# Altium project Monitor_Node.PrjPcb
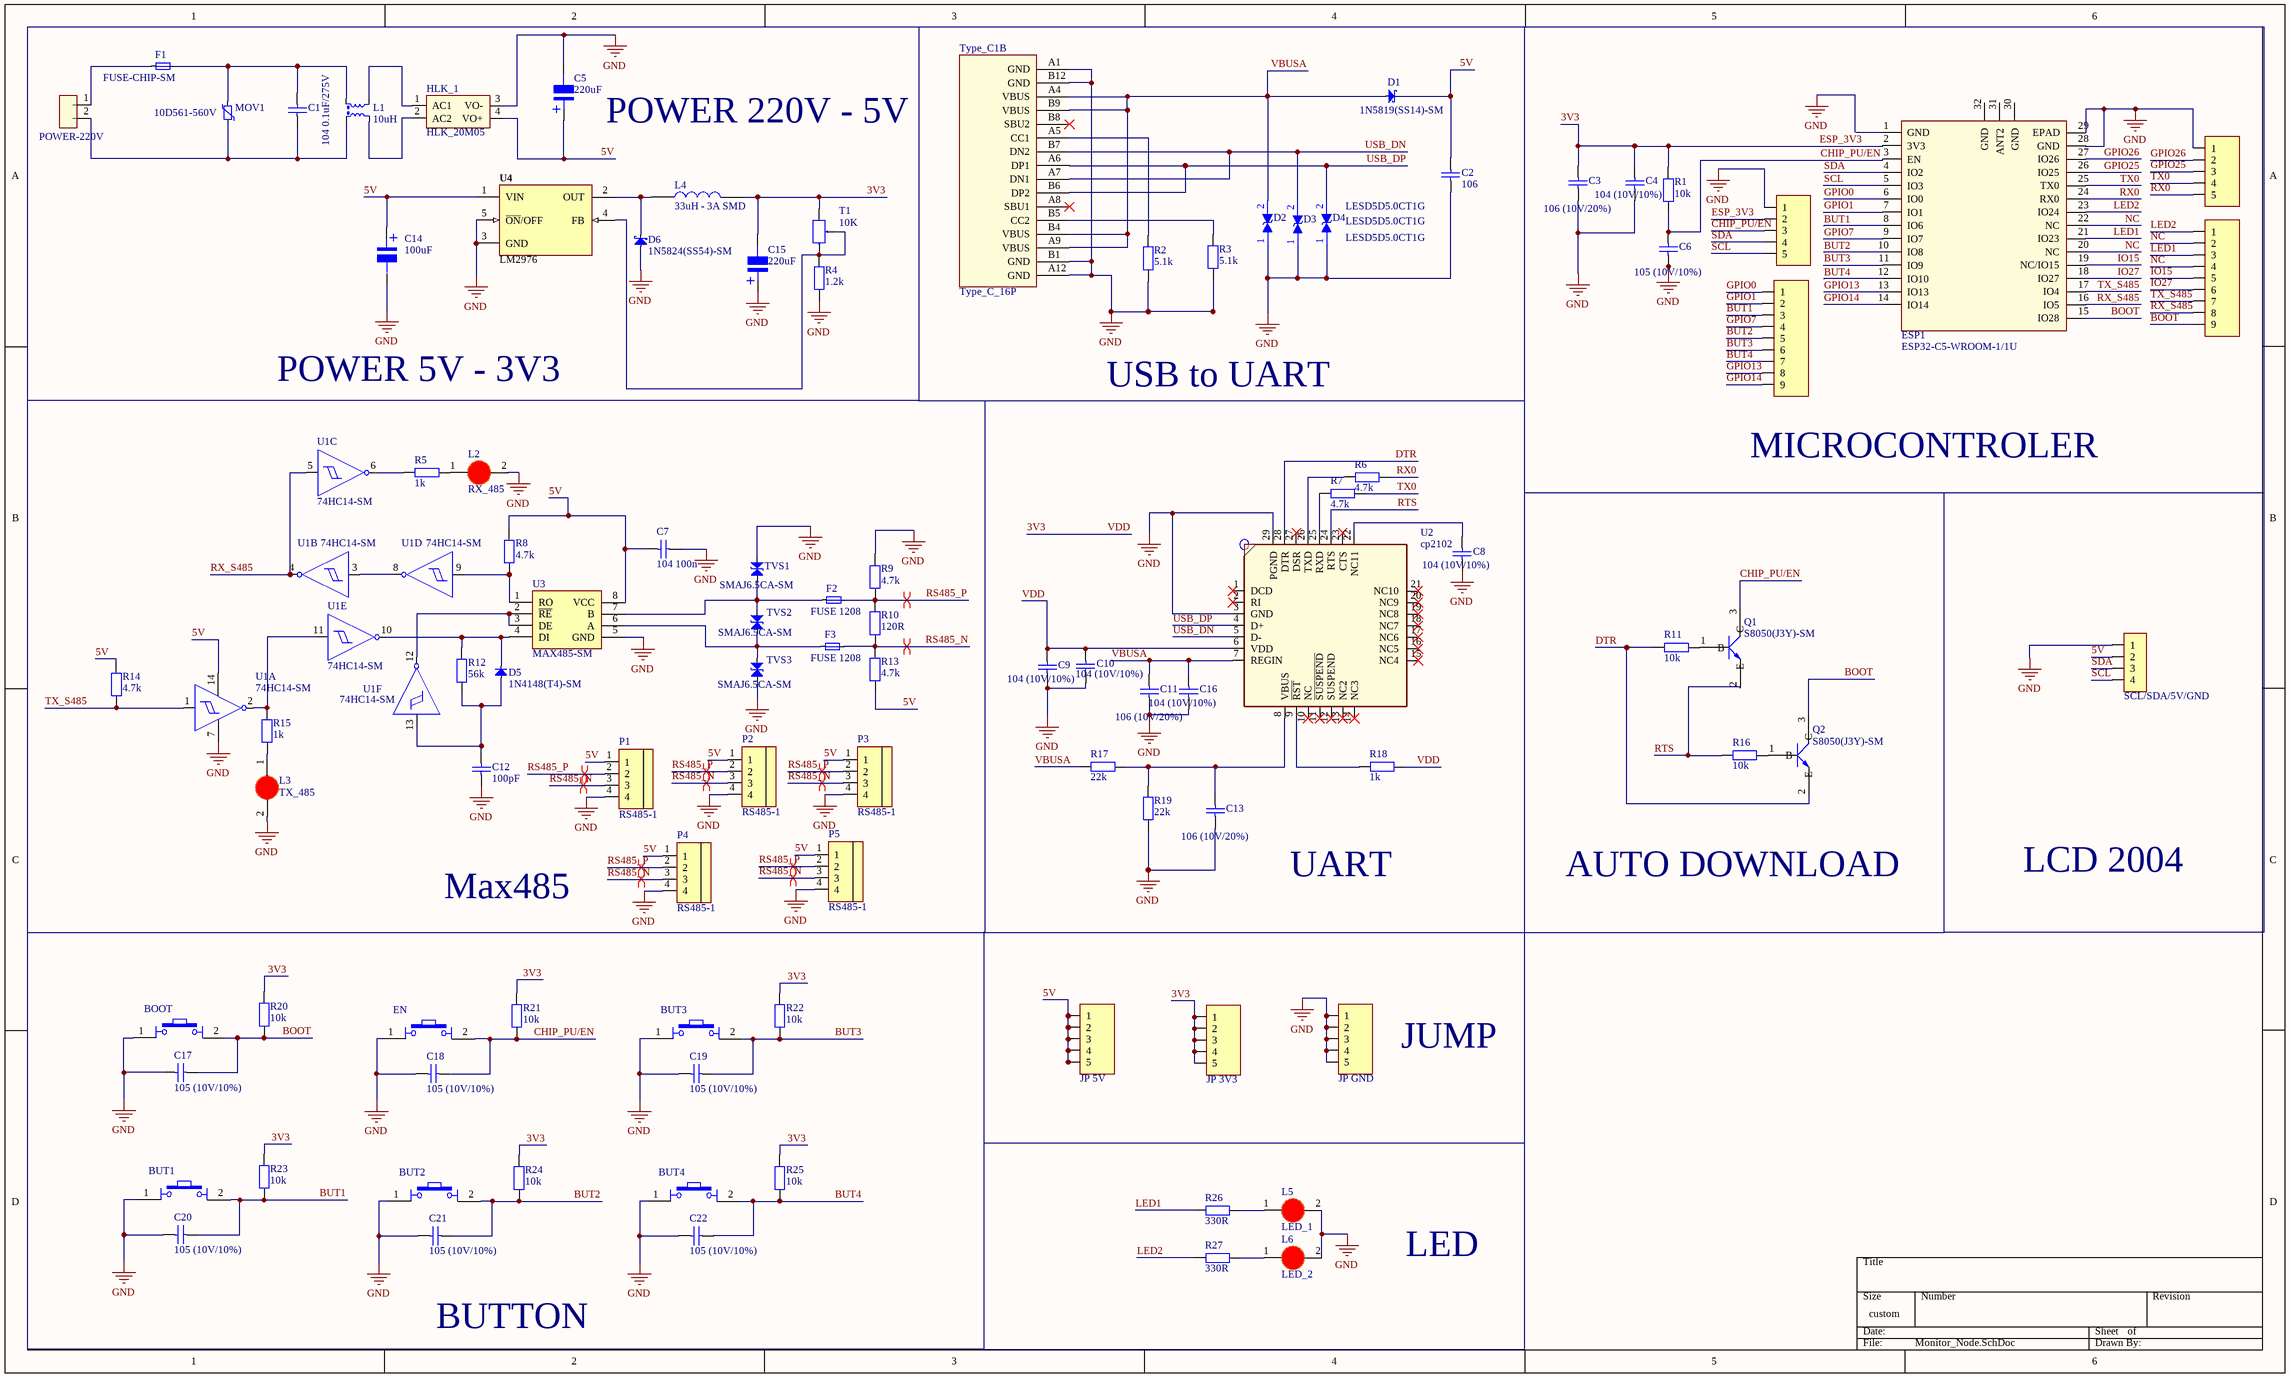
[diagram p0: Monitor_Node.SchDoc]
1 sheet, 98 parts. Net scope: global (net labels, ports and power ports of the same name join across sheets).
Board file: Monitor_Node.PcbDoc

## Sheet Monitor_Node.SchDoc
size 500 x 299 mm; SheetNumber: 1; SheetTotal: 1

### Parts
BT1  BOOT  [Nut Nhan 4 Chan Cam 6x6]
BT2  EN  [Nut Nhan 4 Chan Cam 6x6]
BT3  BUT3  [Nut Nhan 4 Chan Cam 6x6]
BT4  BUT1  [Nut Nhan 4 Chan Cam 6x6]
BT5  BUT2  [Nut Nhan 4 Chan Cam 6x6]
BT6  BUT4  [Nut Nhan 4 Chan Cam 6x6]
C1  104 0.1uF/275V  [tu 0805]
C2  106  [tu 0805]
C3  106 (10V/20%)  [tu 0805]
C4  104 (10V/10%)  [tu 0805]
C5  220uF  [tu nhom 8 (e)]
C6  105 (10V/10%)  [tu 0805]
C7  104 100n  [tu 0805]
C8  104 (10V/10%)  [tu 0805]
C9  104 (10V/10%)  [tu 0805]
C10  104 (10V/10%)  [tu 0805]
C11  106 (10V/20%)  [tu 0805]
C12  100pF  [tu 1206]
C13  106 (10V/20%)  [tu 0805]
C14  100uF  [tu nhom 8 (f)]
C15  220uF  [tu nhom 8 (e)]
C16  104 (10V/10%)  [tu 0805]
C17  105 (10V/10%)  [tu 0805]
C18  105 (10V/10%)  [tu 0805]
C19  105 (10V/10%)  [tu 0805]
C20  105 (10V/10%)  [tu 0805]
C21  105 (10V/10%)  [tu 0805]
C22  105 (10V/10%)  [tu 0805]
D1  1N5819(SS14)-SM  [SMA-J_DO-214AC]
D2  LESD5D5.0CT1G  [LESD5D5.0CT1G,]
D3  LESD5D5.0CT1G  [LESD5D5.0CT1G,]
D4  LESD5D5.0CT1G  [LESD5D5.0CT1G,]
D5  1N4148(T4)-SM  [SOD123G_DO-215AD]
D6  1N5824(SS54)-SM  [SMA-J_DO-214AC]
ESP1  ESP32-C5-WROOM-1/1U  [ESP32-C5-WROOM-1/1U]
F1  FUSE-CHIP-SM  [FUSE-CHIP-1812-SM]
F2  FUSE 1208  [FUSE-CHIP-1812-SM]
F3  FUSE 1208  [FUSE-CHIP-1812-SM]
HB1  POWER-220V  [HB9500]
HLK_1  HLK_20M05  [HLK_20M05]
JP1  JP esp  [JP 1x5 DT]  (value not drawn)
JP2  JP esp  [JP 1x5 DT]  (value not drawn)
JP3  JP esp  [JP 1x9 DT]  (value not drawn)
JP4  JP esp  [JP 1x9 DT]  (value not drawn)
JP5  SCL/SDA/5V/GND  [JP 1x4 DT]
JP6  JP 5V  [JP 1x5 DT]
JP7  JP 3V3  [JP 1x5 DT]
JP8  JP GND  [JP 1x5 DT]
L1  10uH  [L-UU9.8-L17.0-W12.0-H17.0-TH]
L2  RX_485  [LED-3MM-RED]
L3  TX_485  [LED-3MM-RED]
L4  33uH - 3A SMD  [Cuon Cam 12x12x10]
L5  LED_1  [LED-3MM-RED]
L6  LED_2  [LED-3MM-RED]
MOV1  10D561-560V  [MOV-P7.5-D17.0-T3.6-TH]
P1  RS485-1  [15EDG - 4P]
P2  RS485-1  [15EDG - 4P]
P3  RS485-1  [15EDG - 4P]
P4  RS485-1  [15EDG - 4P]
P5  RS485-1  [15EDG - 4P]
Q1  S8050(J3Y)-SM  [SOT23-3_TO-236AB]
Q2  S8050(J3Y)-SM  [SOT23-3_TO-236AB]
R1  10k  [tro smd 0805]
R2  5.1k  [tro smd 0805]
R3  5.1k  [tro smd 0805]
R4  1.2k  [tro smd 0805]
R5  1k  [tro smd 0805]
R6  4.7k  [tro smd 0805]
R7  4.7k  [tro smd 0805]
R8  4.7k  [tro smd 0805]
R9  4.7k  [tro smd 0805]
R10  120R  [tro smd 0805]
R11  10k  [tro smd 0805]
R12  56k  [TRO SMD 0805]
R13  4.7k  [tro smd 0805]
R14  4.7k  [tro smd 0805]
R15  1k  [tro smd 0805]
R16  10k  [tro smd 0805]
R17  22k  [tro smd 0805]
R18  1k  [tro smd 0805]
R19  22k  [tro smd 0805]
R20  10k  [tro smd 0805]
R21  10k  [tro smd 0805]
R22  10k  [tro smd 0805]
R23  10k  [tro smd 0805]
R24  10k  [tro smd 0805]
R25  10k  [tro smd 0805]
R26  330R  [Tro SMD 0805]
R27  330R  [Tro SMD 0805]
T1  10K  [Bien Tro Vi Chinh Dung]
TVS1  SMAJ6.5CA-SM  [SMA-J_DO-214AC_TVS-BI]
TVS2  SMAJ6.5CA-SM  [SMA-J_DO-214AC_TVS-BI]
TVS3  SMAJ6.5CA-SM  [SMA-J_DO-214AC_TVS-BI]
Type_C1  Type_C_16P  [Type_C_16P]  (part B of 2)
U1  74HC14-SM  [SOIC14-1.27-150MIL]  (parts A,B,C,D,E,F of 6)
U2  cp2102  [cp2102]
U3  MAX485-SM  [SOIC8-1.27-150MIL]
U4  LM2976  [TO263]

### Nets
GND: BT1.1 BT2.1 BT3.1 BT4.1 BT5.1 BT6.1 C2.2 C3.2 C4.2 C5.2 C6.2 C7.1 C8.2 C9.2 C10.2 C11.2 C12.2 C13.2 C14.2 C15.1 C16.2 C17.1 C18.1 C19.1 C20.1 C21.1 C22.1 D2.1 D3.1 D4.1 D6.1 ESP1.1(GND) ESP1.28(GND) ESP1.29(EPAD) HLK_1.3(VO-) JP1.1 JP2.1 JP5.1 JP8.1 JP8.2 JP8.3 JP8.4 JP8.5 L2.2(K) L3.2(K) L5.2(K) L6.2(K) P1.4 P2.4 P3.4 P4.4 P5.4 R2.1 R3.1 R4.1 R9.2 R19.1 TVS1.2 TVS3.1 Type_C1.A1(GND) Type_C1.A12(GND) Type_C1.B1(GND) Type_C1.B12(GND) U1.7(GND) U2.3(GND) U2.29(PGND) U3.5(GND) U4.3(GND) U4.5(~{ON}/OFF)
3V3: C3.1 C4.1 C9.1 C10.1 C15.2 ESP1.2(3V3) JP2.2 JP7.1 JP7.2 JP7.3 JP7.4 JP7.5 L4.2 R1.2 R18.2 R20.2 R21.2 R22.2 R23.2 R24.2 R25.2 T1.1 U2.6(VDD)  [also labelled ESP_3V3, VDD]
5V: C2.1 C5.1 C7.2 C14.1 D1.2 HLK_1.4(VO+) JP5.2 JP6.1 JP6.2 JP6.3 JP6.4 JP6.5 P1.1 P2.1 P3.1 P4.1 P5.1 R8.2 R13.1 R14.2 U1.14(VCC) U3.8(VCC) U4.1(VIN)
BOOT: BT1.2 C17.2 ESP1.15(IO28) JP3.9 Q2.3(C) R20.1
BUT1: BT4.2 C20.2 ESP1.8(IO6) JP4.3 R23.1
BUT2: BT5.2 C21.2 ESP1.10(IO8) JP4.5 R24.1
BUT3: BT3.2 C19.2 ESP1.11(IO9) JP4.6 R22.1
BUT4: BT6.2 C22.2 ESP1.12(IO10) JP4.7 R25.1
CHIP_PU/EN: BT2.2 C6.1 C18.2 ESP1.3(EN) JP2.3 Q1.3(C) R1.1 R21.1
DTR: Q2.2(E) R11.1 U2.28(DTR)
GPIO0: ESP1.6(IO0) JP4.1
GPIO1: ESP1.7(IO1) JP4.2
GPIO7: ESP1.9(IO7) JP4.4
GPIO13: ESP1.13(IO13) JP4.8
GPIO14: ESP1.14(IO14) JP4.9
GPIO25: ESP1.26(IO25) JP1.3
GPIO26: ESP1.27(IO26) JP1.2
IO15: ESP1.19(NC/IO15) JP3.5
IO27: ESP1.18(IO27) JP3.6
LED1: ESP1.21(IO23) JP3.3 R26.1
LED2: ESP1.23(IO24) JP3.1 R27.1
NC: ESP1.20(NC) ESP1.22(NC) JP3.2 JP3.4
RS485_N: F3.2 P1.3 P2.3 P3.3 P4.3 P5.3 R10.1 R13.2
RS485_P: F2.2 P1.2 P2.2 P3.2 P4.2 P5.2 R9.1 R10.2
RTS: Q1.2(E) R16.1 U2.24(RTS)
RX0: ESP1.24(RX0) JP1.5 R6.2
RX_S485: ESP1.16(IO5) JP3.8 U1.4(OUT) U1.5(IN)
SCL: ESP1.5(IO3) JP2.5 JP5.4
SDA: ESP1.4(IO2) JP2.4 JP5.3
TX0: ESP1.25(TX0) JP1.4 R7.2
TX_S485: ESP1.17(IO4) JP3.7 R14.1 U1.1(IN)
USB_DN: D3.2 Type_C1.A7(DN1) Type_C1.B7(DN2) U2.5(D-)
USB_DP: D4.2 Type_C1.A6(DP1) Type_C1.B6(DP2) U2.4(D+)
VBUSA: C11.1 C16.1 D1.1 D2.2 R17.1 Type_C1.A4(VBUS) Type_C1.A9(VBUS) Type_C1.B4(VBUS) Type_C1.B9(VBUS) U2.7(REGIN)
NetC1_1: C1.1 F1.2 L1.3 MOV1.1
NetC1_2: C1.2 HB1.2 L1.1 MOV1.2
NetC8_1: C8.1 U2.22(NC11)
NetC12_1: C12.1 D5.1 R12.1 U1.13(IN)
NetC13_1: C13.1 R17.2 R19.2 U2.8(VBUS)
NetD5_2: D5.2 R12.2 U1.10(OUT) U3.4(DI)
NetD6_2: D6.2 L4.1 U4.2(OUT)
NetF1_1: F1.1 HB1.1
NetF2_1: F2.1 TVS1.1 TVS2.2 U3.7(B)
NetF3_1: F3.1 TVS2.1 TVS3.2 U3.6(A)
NetHLK_1_1: HLK_1.1(AC1) L1.4
NetHLK_1_2: HLK_1.2(AC2) L1.2
NetL2_1: L2.1(A) R5.2
NetL3_1: L3.1(A) R15.1
NetL5_1: L5.1(A) R26.2
NetL6_1: L6.1(A) R27.2
NetQ1_1: Q1.1(B) R11.2
NetQ2_1: Q2.1(B) R16.2
NetR2_2: R2.2 Type_C1.A5(CC1)
NetR3_2: R3.2 Type_C1.B5(CC2)
NetR4_2: R4.2 T1.2 T1.3 U4.4(FB)
NetR5_1: R5.1 U1.6(OUT)
NetR6_1: R6.1 U2.26(TXD)
NetR7_1: R7.1 U2.25(RXD)
NetR8_1: R8.1 U1.9(IN) U3.1(RO)
NetR15_2: R15.2 U1.2(OUT) U1.11(IN)
NetR18_1: R18.1 U2.9(~{RST})
NetU1_3: U1.3(IN) U1.8(OUT)
NetU1_12: U1.12(OUT) U3.2(~{RE}) U3.3(DE)

Not connected (* = marked no-connect by the designer): ESP1 30(GND) 31(ANT2) 32(GND); Type_C1 A8(SBU1)* B8(SBU2)*; U2 1(DCD)* 2(RI)* 10(NC)* 11(~{SUSPEND})* 12(SUSPEND)* 13(NC2)* 14(NC3)* 15(NC4)* 16(NC5)* 17(NC6)* 18(NC7)* 19(NC8)* 20(NC9)* 21(NC10)* 23(CTS)* 27(DSR)*

### Layout directives
differential pair: RS485_N, RS485_P

### Notes on the sheet
- POWER 220V - 5V
- POWER 5V - 3V3
- USB to UART
- (near JP4) MICROCONTROLER
- Max485
- UART
- AUTO DOWNLOAD
- LCD 2004
- JUMP
- LED
- BUTTON
- (in symbol Tu Nhom 100uF 50V) +
- (in symbol Tu Nhom 220uF 10V) +

### Library data of the parts
BT1-BT6 = Nut Nhan 4 Chan Cam 6x6: Nut Nhan 4 Chan 6x6mm; Ten: Nút Nhấn 4 Chân 6x6x5MM DIP; Ma_Hang: MH004584
C1 C4 C7-C10 C16 = Tu 0805 104 50V 10%: Dán; Don_Vi: Con; So_Chan: 2; Ten_Linh_Kien: Tụ 0805 104-100nF 10% 50V; Ma_Hang: MH004551; Chung_Loai: Dán; Kieu_Chan: *
C2 C3 C11 C13 = Tu 0805 106 16V 10%: Dán; Ten_Linh_Kien: Tụ 0805 106-10uF 10% 16V; So_Chan: 2; Don_Vi: Con; Ma_Hang: MH004553; Chung_Loai: Dán; Kieu_Chan: *
C5 C15 = Tu Nhom 220uF 10V: Dán; So_Chan: 2; Ten_Linh_Kien: Tụ Nhôm 220uF 10V; Ma_Hang: MH004021; Don_Vi: Con; Chung_Loai: Dán; Kieu_Chan: *
C6 C17-C22 = Tu 0805 105 50V 10%: Dán; Don_Vi: Con; So_Chan: 2; Ten_Linh_Kien: Tụ 0805 105-1uF 10% 50V; Ma_Hang: MH004552; Chung_Loai: Dán; Kieu_Chan: *
C12 = Tu 1206 4.7nF 50V: Dán; Don_Vi: Con; So_Chan: 2; Ten_Linh_Kien: Tụ 1206 4.7nF 50V NPO; Ma_Hang: MH007538; Chung_Loai: Dán; Kieu_Chan: *
C14 = Tu Nhom 100uF 50V: Dán; Don_Vi: Con; So_Chan: 2; Ten_Linh_Kien: Tụ Nhôm 100uF 50V 8x10.2MM; Ma_Hang: MH002223; Chung_Loai: Dán; Kieu_Chan: *
D1 = 1N5819(SS14)-SM: 1.0A Schottky Barrier Rectifiers - Surface Mount
D5 = 1N4148(T4)-SM: Fast Switching Diode - Surface Mount
D6 = 1N5824(SS54)-SM: 5.0A Schottky Barrier Rectifiers - Surface Mount
F1-F3 = FUSE-CHIP-SM: Chip Fuses - Surface Mount
HB1 = HB9500
JP1 JP2 JP6-JP8 = JP 1x5 2.54 Duc Thang: Cắm; Ten_Linh_Kien: Jump Đơn Đực 2.54MM 1x40P Thẳng 11MM; Don_Vi: Con; Ma_Hang: MH000903; Ghi_Chu: *; Kieu_Chan: *; Chung_Loai: Cắm
JP3 JP4 = JP 1x9 2.54 Duc Thang: Cắm; Ten_Linh_Kien: Jump Đơn Đực 2.54MM 1x40P Thẳng 11MM; Don_Vi: Con; Ma_Hang: MH000903; Ghi_Chu: *; Kieu_Chan: *; Chung_Loai: Cắm
JP5 = JP 1x4 2.54 Duc Thang: Cắm; Ten_Linh_Kien: Jump Đơn Đực 2.54MM 1x40P Thẳng 11MM; Don_Vi: Con; Ma_Hang: MH000903; Ghi_Chu: *; Kieu_Chan: *; Chung_Loai: Cắm
L1 = L-FILTER-TH: EMI Filter Inductor - Through Hole
L2 L3 L5 L6 = LED 3mm Do: Cắm; Don_Vi: Con; Ma_Hang: MH003892; Ten_Linh_Kien: Led 3MM Phủ Đỏ (10c); Ghi_Chu: *; Kieu_Chan: *; Chung_Loai: Cắm
L4 = CUON CAM 100uH SMD: Dán; Don_Vi: Con; Ma_Hang: MH003999; Ten_Linh_Kien: Cuộn Cảm 100uH 7x7x4MM CD74; Ma_Hang: *; Kieu_Chan: *; Chung_Loai: Dán
MOV1 = MOV-TH: Metal Oxide Varistor - Through Hole
P1-P5 = 15EDG - 4P: 15EDG - 4P - 3.81 mm
Q1 Q2 = S8050(J3Y)-SM: 0.5A 25V NPN General Purpose Transistors - Surface Mount
R1 R11 R16 R20-R25 = Tro 0805 5% 10k: Dán; Don_Vi: Con; So_Chan: 2; Ten_Linh_Kien: Trở 0805 5% 10k; Ma_Hang: MH005239; Chung_Loai: Dán; Kieu_Chan: *
R2 R3 = Tro 0805 1% 5.1k: Dán; Don_Vi: Con; So_Chan: 2; Ten_Linh_Kien: Trở 0805 1% 5.1k; Ma_Hang: MH008812; Chung_Loai: Dán; Kieu_Chan: *
R4 = Tro 0805 5% 1.2k: Dán; Don_Vi: Con; So_Chan: 2; Ten_Linh_Kien: Trở 0805 5% 1.2k; Ma_Hang: MH005231; Chung_Loai: Dán; Kieu_Chan: *
R5 R15 R18 = Tro 0805 1% 1k: Dán; Don_Vi: Con; So_Chan: 2; Ten_Linh_Kien: Trở 0805 1% 1k; Ma_Hang: MH005468; Chung_Loai: Dán; Kieu_Chan: *
R6-R9 R13 R14 = Tro 0805 5% 4.7k: Dán; Don_Vi: Con; So_Chan: 2; Ten_Linh_Kien: Trở 0805 5% 4.7k; Ma_Hang: MH005307; Chung_Loai: Dán; Kieu_Chan: *
R10 = Tro 0805 5% 120R: Dán; Don_Vi: Con; So_Chan: 2; Ten_Linh_Kien: Trở 0805 5% 120R; Ma_Hang: MH005253; Chung_Loai: Dán; Kieu_Chan: *
R12 = Tro 0805 5% 56k: Dán; Don_Vi: Con; So_Chan: 2; Ten_Linh_Kien: Trở 0805 5% 56k; Ma_Hang: MH005322; Chung_Loai: Dán; Kieu_Chan: *
R17 R19 = Tro 0805 5% 22k: Dán; Don_Vi: Con; So_Chan: 2; Ten_Linh_Kien: Trở 0805 5% 22k; Ma_Hang: MH005248; Chung_Loai: Dán; Kieu_Chan: *
R26 R27 = Tro 0805 5% 330R: Dán; Don_Vi: Con; So_Chan: 2; Ten_Linh_Kien: Trở 0805 5% 330R; Ma_Hang: MH005337; Chung_Loai: Dán; Kieu_Chan: *
T1 = Bien Tro Tinh Chinh 10K Dung: Cắm; Ma_Hang: MH003232; Ten_Linh_Kien: Biến Trở VR 103-10K 3296W; Don_Vi: Con; Kieu_Chan: *; Chung_Loai: Cắm; Ghi_Chu: *
TVS1-TVS3 = SMAJ6.5CA-SM: ESD Suppressors/TVS Diodes 6.5V Bi-Dir - Surface Mount
U1 = 74HC14-SM: Hex Inverting Schmitt Trigger - Surface Mount
U3 = MAX485-SM: Low-Power, Slew-Rate-Limited RS-485/RS-422 Transceivers - Surface Mount
U4 = LM2596: Max Input Voltage: 12 V; Max Output Current: 3 (6.0 peak) A; Max Output Voltage: mV; Category: IC-Power; Min Input Voltage: mV; Min Output Voltage: mV; Mounting Technology: Surface Mount; Status: Unreleased; Supply Voltage: mV; Temperature Range: -40 to +125 degC